# Altium schematic sheet 04_SIM_RF.SchDoc
size A3; SheetNumber: 4; SheetTotal: 4
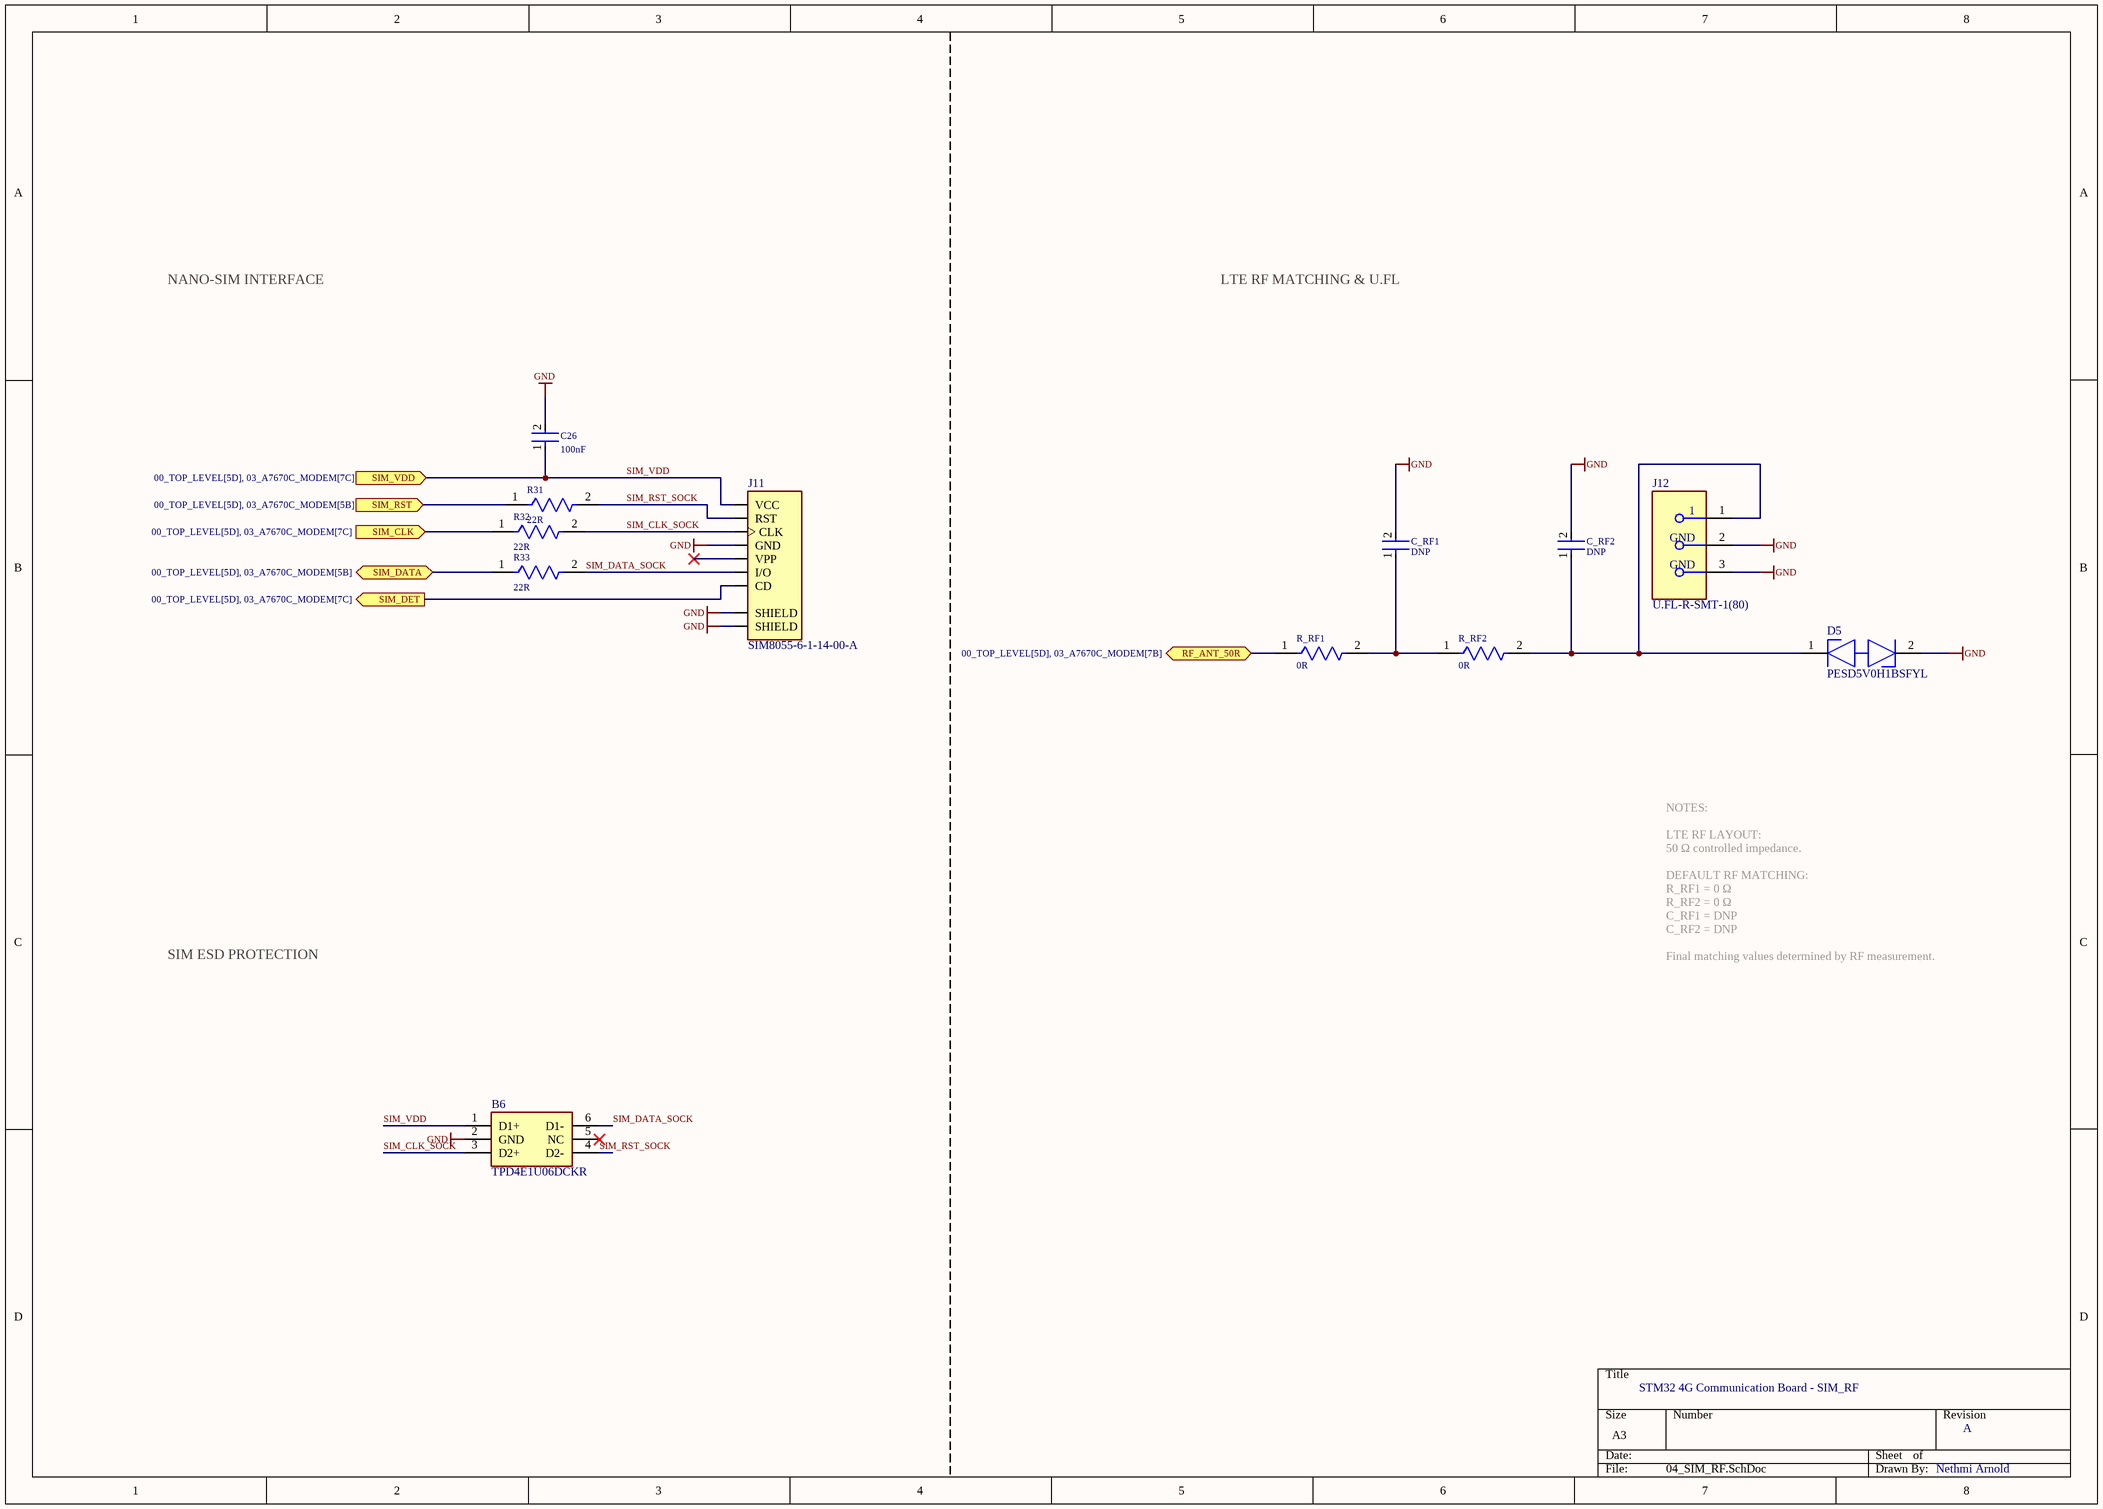
[diagram p0: 04_SIM_RF.SchDoc]

## Parts
B6  TPD4E1U06DCKR  [SOT65P210X110-6N]
C26  100nF  [FP-CC0402-IPC_C]
C_RF1  DNP  [FP-CC0402-IPC_C]
C_RF2  DNP  [FP-CC0402-IPC_C]
D5  PESD5V0H1BSFYL  [FP-SOD962-2-MFG]
J11  SIM8055-6-1-14-00-A  [GCT_SIM8055-6-1-14-00-A]
J12  U.FL-R-SMT-1(80)  [FP-U_FL-R-SMT-1_80-MFG]
R31  22R  [FP-AC0603-IPC_C]
R32  22R  [FP-AC0603-IPC_C]
R33  22R  [FP-AC0603-IPC_C]
R_RF1  0R  [FP-CRG0402-IPC_A]
R_RF2  0R  [FP-CRG0402-IPC_A]

## Ports
RF_ANT_50R (bidir, see 00_TOP_LEVEL[5D], 03_A7670C_MODEM[7B]), SIM_CLK (in, see 00_TOP_LEVEL[5D], 03_A7670C_MODEM[7C]), SIM_DATA (bidir, see 00_TOP_LEVEL[5D], 03_A7670C_MODEM[5B]), SIM_DET (out, see 00_TOP_LEVEL[5D], 03_A7670C_MODEM[7C]), SIM_RST (in, see 00_TOP_LEVEL[5D], 03_A7670C_MODEM[5B]), SIM_VDD (in, see 00_TOP_LEVEL[5D], 03_A7670C_MODEM[7C])

## Nets
GND: B6.2(GND) C26.2 C_RF1.2 C_RF2.2 D5.2(K2) J11.C4(SHIELD) J11.C5(GND) J11.C8(SHIELD) J12.2(GND) J12.3(GND)
RF_ANT_50R: R_RF1.1 ; port RF_ANT_50R
SIM_CLK: R32.1 ; port SIM_CLK
SIM_CLK_SOCK: B6.3(D2+) J11.C3(CLK) R32.2
SIM_DATA: R33.1 ; port SIM_DATA
SIM_DATA_SOCK: B6.6(D1-) J11.C7(I/O) R33.2
SIM_DET: J11.CD ; port SIM_DET
SIM_RST: R31.1 ; port SIM_RST
SIM_RST_SOCK: B6.4(D2-) J11.C2(RST) R31.2
SIM_VDD: B6.1(D1+) C26.1 J11.C1(VCC) ; port SIM_VDD
NetC_RF1_1: C_RF1.1 R_RF1.2 R_RF2.1
NetC_RF2_1: C_RF2.1 D5.1(K1) J12.1 R_RF2.2

Not connected (* = marked no-connect by the designer): B6 5(NC)*; J11 C6(VPP)*

## Notes on the sheet
- NANO-SIM INTERFACE
- LTE RF MATCHING & U.FL
- LTE RF LAYOUT:
  50 Ω controlled impedance.
- NOTES:
- SIM ESD PROTECTION
- DEFAULT RF MATCHING:
  R_RF1 = 0 Ω
  R_RF2 = 0 Ω
  C_RF1 = DNP
  C_RF2 = DNP
  Final matching values determined by RF measurement.
- STM32 4G Communication Board - SIM_RF
- A
- Nethmi Arnold

## Library data of the parts
B6 = TPD4E1U06DCKR: Quad-Channel High-Speed ESD Protection Device; Manufacturer_Name: Texas Instruments; Geometry.Height: 1.1mm; Manufacturer_Part_Number: TPD4E1U06DCKR; Mouser Part Number: 595-TPD4E1U06DCKR; Mouser Price/Stock: https://www.mouser.co.uk/ProductDetail/Texas-Instruments/TPD4E1U06DCKR?qs=FBI%252BX3tnPf27UOVCu86Dnw%3D%3D; Arrow Part Number: TPD4E1U06DCKR; Arrow Price/Stock: https://www.arrow.com/en/products/tpd4e1u06dckr/texas-instruments?utm_currency=USD&region=nac; Datasheet Link: http://www.ti.com/lit/gpn/tpd4e1u06
C26 = CMP-03422-000905-1: CC0402 100 nF X5R 20.00% 25 V; Manufacturer: YAGEO; Manufacturer Part Number: CC0402MRX5R8BB104; Temperature Coefficient: 30ppm/°C; Voltage Rating: 25 V; Tolerance: 0.2; Material: Ceramic; Automotive Grade: NA; Ipc Land Pattern Name: CAPC10050X50; RoHS: TRUE; Value: 100 nF; Footprint Url: http://www.yageo.com/exep/pages/download/literatures/UPY-C_GEN_24.pdf; ComponentLink2URL: http://www.yageo.com/documents/recent/UPY-GP_NP0_16V-to-50V_16.pdf; Device Class L2: Capacitors; Octopart: https://octopart.com/cc0402mrx5r8bb104-yageo-95634517; Device Class L3: Ceramic Capacitors; Capacitance: 100 nF; Temperature: -55°C to +125°C; Package: CC0402; Automotive: No; Temperature Range Low: -55°C; Temperature Range High: +125°C; Lead Free: Yes; Temperature Characteristic: X5R; Category: Cap; Height: 0.55mm; Device Class L1: Passive Components; ComponentLink2Description: Datasheet
C_RF1 C_RF2 = CMP-03422-000670-1: CAP CER 0.033UF 6.3V X5R 0402; Manufacturer Part Number: CC0402KRX5R5BB333; Manufacturer: YAGEO; Value: 33 nF; Temperature Coefficient: 30ppm/°C; Tolerance: 0.1; Automotive Grade: NA; RoHS: TRUE; Voltage Rating: 6.3 V; Digikey Description: CAP CER 0.033UF 6.3V X5R 0402; Footprint Url: http://www.yageo.com/exep/pages/download/literatures/UPY-C_GEN_24.pdf; Package: CC0402; Octopart: https://octopart.com/cc0402krx5r5bb333-yageo-71334363; ComponentLink2URL: http://www.yageo.com/documents/recent/UPY-GP_NP0_16V-to-50V_16.pdf; Device Class L3: Ceramic Capacitors; Temperature: -55°C to +125°C; Capacitance: 33 nF; Height: 0.55mm; Temperature Range High: +125°C; Temperature Range Low: -55°C; Automotive: No; Device Class L1: Passive Components; Lead Free: Yes; Temperature Characteristic: X5R; Device Class L2: Capacitors; Ipc Land Pattern Name: CAPC10050X50; Category: Cap; Material: Ceramic; ComponentLink2Description: Datasheet
D5 = CMP-14436-000004-1: TVS DIODE 5V 5V DSN0603-2; Manufacturer: Nexperia; Breakdown Voltage: 6V; Direction: Bidirectional; Value: 0.15pF; Clamping Voltage: 6.3V; Number Of Channels: 1; Peak Pulse Current: 7A; Max Junction Temp: +150°C; Lead Free: Yes; Reverse Standoff Voltage: 5V; Footprint Url: https://assets.nexperia.com/documents/outline-drawing/SOD962-2.pdf; ComponentLink2Description: Datasheet; Height: 0.32mm; Ambient Temperature Range Low: -40°C; Manufacturer Part Number: PESD5V0H1BSFYL; Octopart: https://octopart.com/pesd5v0h1bsfyl-nexperia-78741149; Ambient Temperature Range High: +125°C; RoHS: TRUE; Temperature: to +150°C; Capacitance: 0.15pF; ComponentLink2URL: https://assets.nexperia.com/documents/data-sheet/PESD5V0H1BSF.pdf; Temperature Range High: +150°C; Device Class L2: TVS Diodes; Digikey Description: TVS DIODE 5V 5V DSN0603-2; Category: Diode; Device Class L3: unset; Device Class L1: Circuit Protection; Package: SOD962-2; Automotive: No
J11 = SIM8055-6-1-14-00-A: 7 (6 + 1) Position Card Connector NANO SIM Surface Mount, Right Angle Gold; MF: Global Connector Technology; SnapEDA_Link: https://www.snapeda.com/parts/SIM8055-6-1-14-00-A/Global+Connector+Technology/view-part/?ref=snap; Package: None; Value: *; MP: SIM8055-6-1-14-00-A; Check_prices: https://www.snapeda.com/parts/SIM8055-6-1-14-00-A/Global+Connector+Technology/view-part/?ref=eda
J12 = CMP-11598-000004-1: CONN U.FL RCPT STR 50 OHM SMD; Mating Cycles: 30; Impedance: 50R; Body Plating: Silver; Center Contact Plating: Gold; Body Material: Bronze; Dielectric Material: Polymer; Connector Type: Receptacle; Number of Ports: 1; Max Frequency: 6GHz; Mount: Surface Mount; Termination: Solder; Case/Package: SMD/SMT; Min Operating Temperature: -40°C; Series: U.FL; Max Operating Temperature: 90°C; Fastening Type: SNAP-ON; RoHS Compliant: Yes; Packaging: Tape and Reel; Package Quantity: 10000; Contact Material: Brass; Housing Color: Beige; Lead Free: Lead Free
R31-R33 = CMP-03412-040387-1: RES 22Ω 5.00% 0.1W 0603; Power Rating: 100mW; Temperature Coefficient: 100ppm/°C; Voltage Rating: 50V; Tolerance: 5%; Series: AC; Resistance: 22R; Width: 0.8mm; Termination: SMD/SMT; Case/Package: 0603; Min Operating Temperature: -55°C; Resistor Type: Thick Film; Number of Terminations: 2; Ratings: AEC-Q200; Features: Moisture Resistant; Length: 1.6mm; Packaging: Tape and Reel; Max Power Dissipation: 100mW; Case Code (Imperial): 0603; Height: 0.45mm; Max Operating Temperature: 155°C; Case Code (Metric): 1608
R_RF1 R_RF2 = CMP-03211-011400-1: RES SMD 0 OHM JUMPER 1/16W 0402; Number of Resistors: 1; Tolerance: 0%; Voltage Rating: 50V; Insulation Resistance: 1GR; Power Rating: 63mW; Temperature Coefficient: 200ppm/°C; Resistance: 0mR; Weight: 2.3E-05oz; Number of Terminations: 2; Technology: THICK FILM; Resistor Type: Thick Film; Mount: Surface Mount; Termination: Solder; Number of Pins: 2; RoHS Compliant: Yes; Packaging: Tape and Reel; Depth: 0.5mm; Case Code (Metric): 1005; Min Operating Temperature: -55°C; Series: CRG; Height: 0.35mm; Voltage Rating (DC): 50V; Case Code (Imperial): 0402; Max Operating Temperature: 125°C; ELV: Compliant; Case/Package: 0402; Length: 1mm; Radiation Hardening: No; Width: 0.5mm; Package Quantity: 10000